# Altium schematic sheet MPS27102017.schdoc
size A3
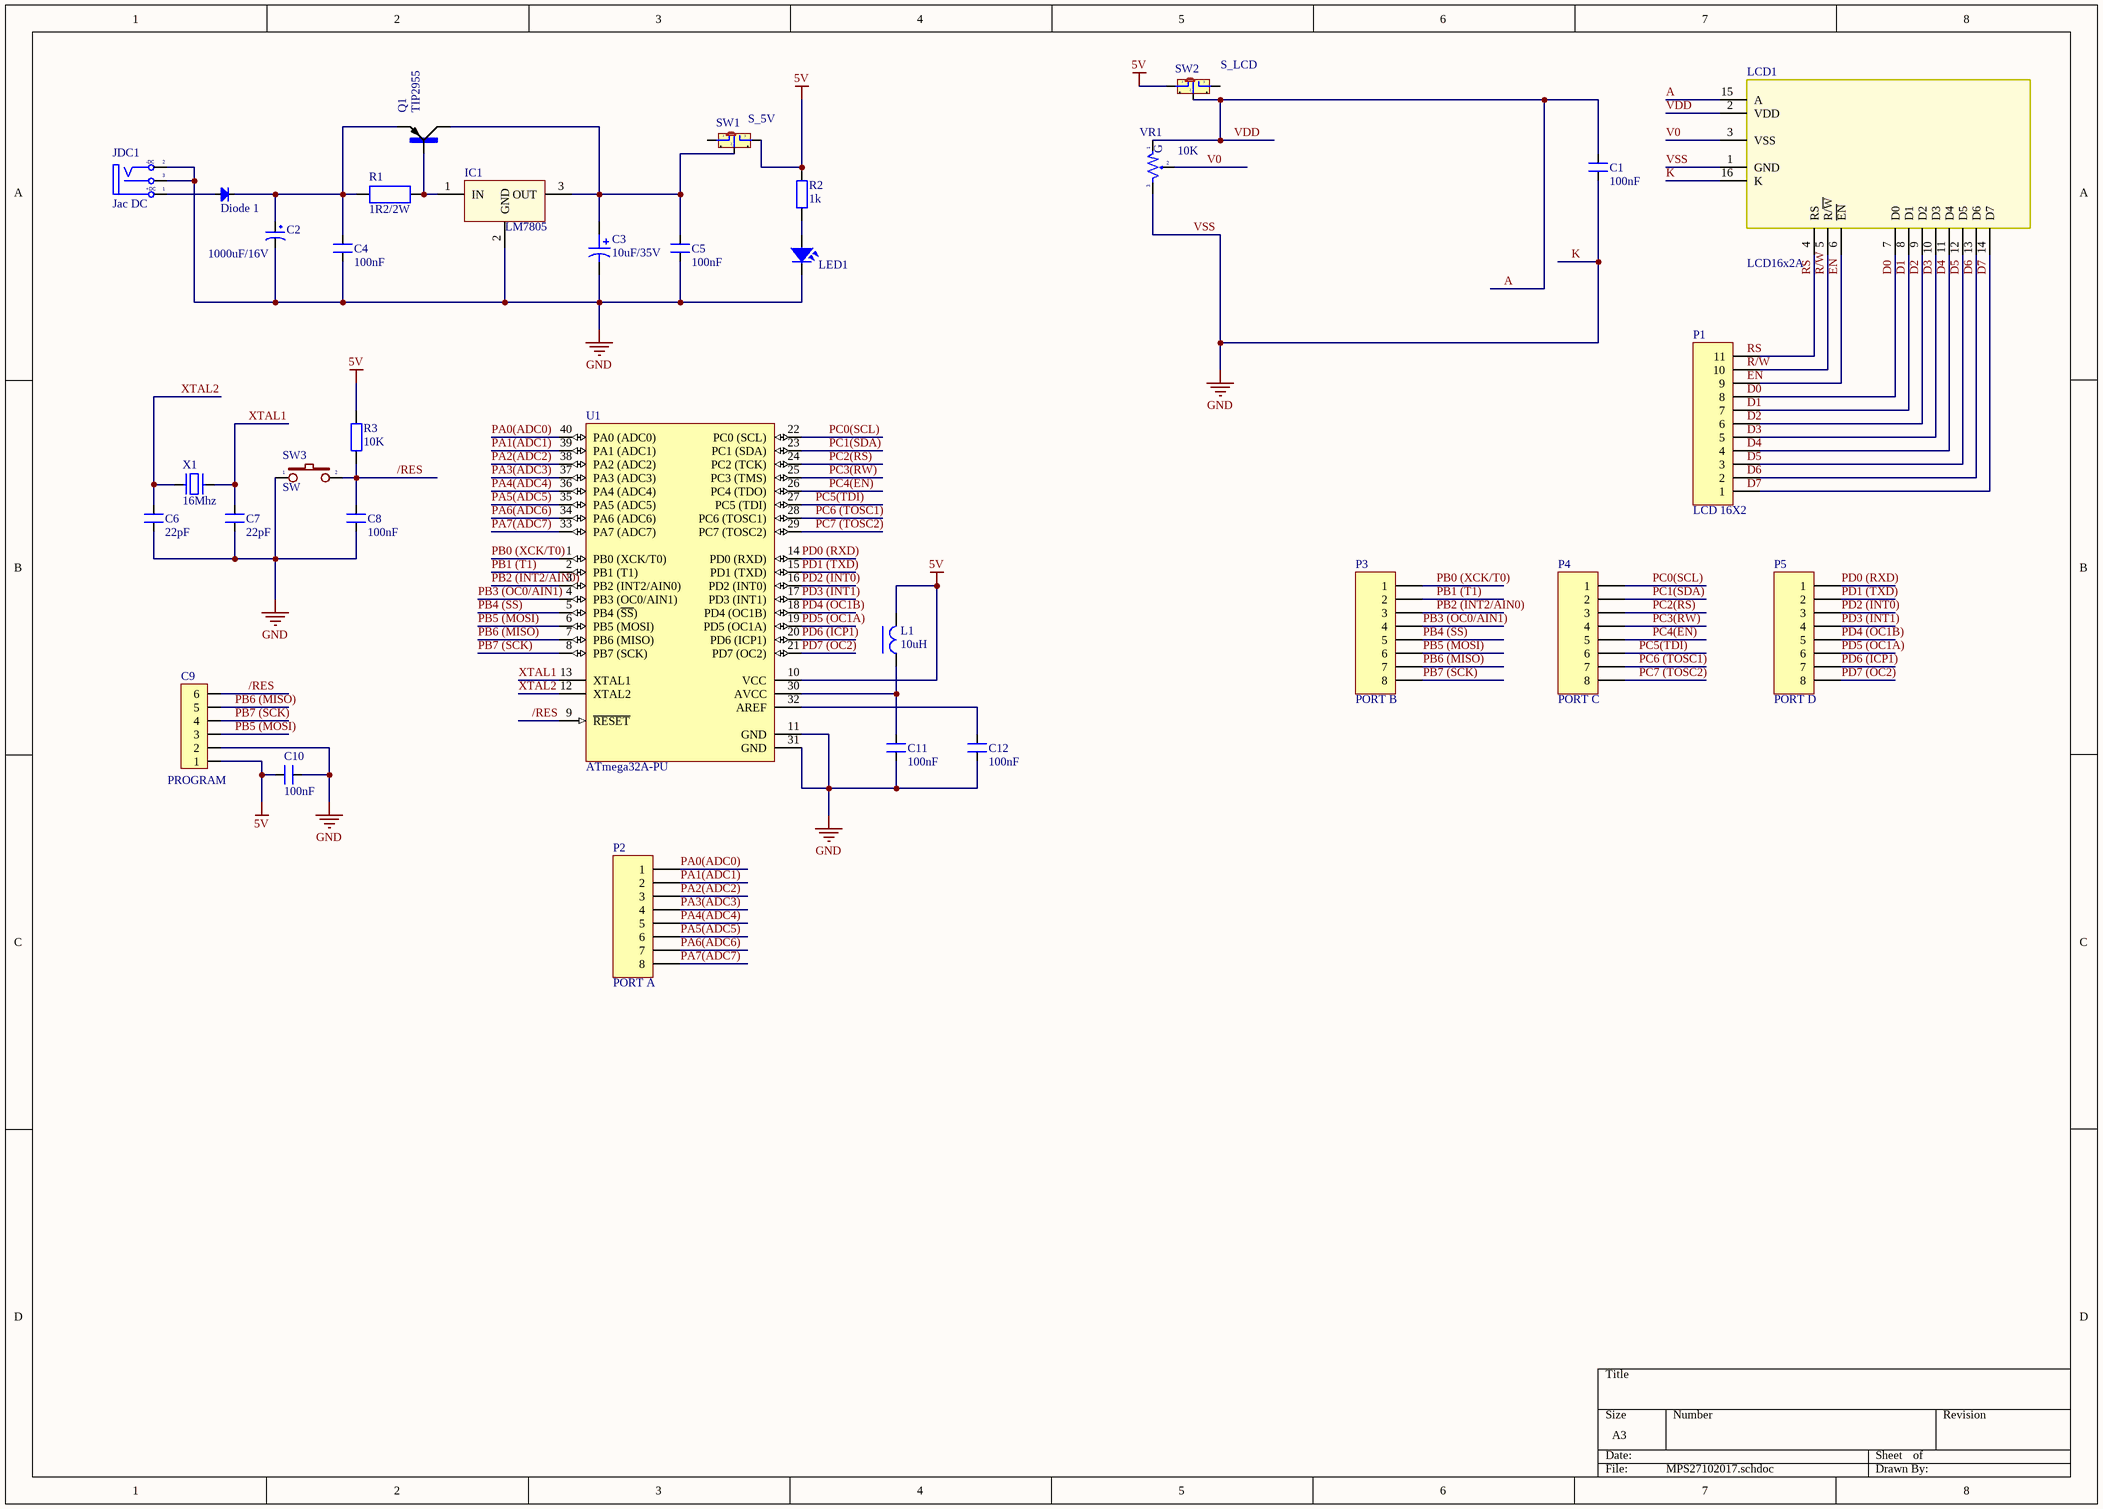
[diagram p0: MPS27102017.schdoc]

## Parts
C1  100nF  [CN1]
C2  1000uF/16V  [CP1.5/3.4]
C3  value 10uF/35V  [RADIAL B]  (hidden comment: Cap Pol)
C4  100nF  [CN1]
C5  100nF  [CN1]
C6  22pF  [CN1]
C7  22pF  [CN1]
C8  100nF  [CN1]
C9  PROGRAM  [Header6]
C10  100nF  [CN1]
C11  100nF  [CN1]
C12  100nF  [CN1]
Diode_1  Diode 1N5404  [DIO-5A - LONG]  (value not drawn)
IC1  LM7805  [QTO-220H3]
JDC1  Jac DC  [DC0]
L1  10uH  [RES-1/2W]
LCD1  LCD16x2A  [LCD16X2]
LED1  LED  [LED-3MM-YELLOW]  (value not drawn)
P1  LCD 16X2  [HDR1X11]
P2  PORT A  [Header 8]
P3  PORT B  [Header 8]
P4  PORT C  [Header 8]
P5  PORT D  [Header 8]
Q1  TIP2955  [TOP3AV_TIP2955(Primary)]
R1  1R2/2W  [R2W]
R2  1k  [R1/4W]
R3  10K  [R1/4W]
SW1  S_5V  [SW102]
SW2  S_LCD  [SW102]
SW3  SW  [SW2]
U1  ATmega32A-PU  [DIP40/W0.6]
VR1  10K  [VR-S2]
X1  16Mhz  [XT2]

## Nets
5V: C9.1 C10.1 L1.2 R2.2 R3.2 SW1.3 SW2.1 U1.10(VCC)
K: C1.1 C2.2 C3.2 C4.1 C5.1 C6.1 C7.1 C8.1 C9.2 C10.2 C11.1 C12.1 IC1.2(GND) JDC1.2(TN) JDC1.3(S) LCD1.1(GND) LCD1.16(K) LED1.2 SW3.1 U1.11(GND) U1.31(GND) VR1.3  [also labelled GND, VSS]
/RES: C8.2 C9.6 R3.1 SW3.2 U1.9(~{RESET})
A: C1.2 LCD1.2(VDD) LCD1.15(A) SW2.2 VR1.1  [also labelled VDD]
D0: LCD1.7(D0) P1.8
D1: LCD1.8(D1) P1.7
D2: LCD1.9(D2) P1.6
D3: LCD1.10(D3) P1.5
D4: LCD1.11(D4) P1.4
D5: LCD1.12(D5) P1.3
D6: LCD1.13(D6) P1.2
D7: LCD1.14(D7) P1.1
EN: LCD1.6(~{EN}) P1.9
PA0(ADC0): P2.1 U1.40(PA0_(ADC0))
PA1(ADC1): P2.2 U1.39(PA1_(ADC1))
PA2(ADC2): P2.3 U1.38(PA2_(ADC2))
PA3(ADC3): P2.4 U1.37(PA3_(ADC3))
PA4(ADC4): P2.5 U1.36(PA4_(ADC4))
PA5(ADC5): P2.6 U1.35(PA5_(ADC5))
PA6(ADC6): P2.7 U1.34(PA6_(ADC6))
PA7(ADC7): P2.8 U1.33(PA7_(ADC7))
PB0 (XCK/T0): P3.1 U1.1(PB0_(XCK/T0))
PB1 (T1): P3.2 U1.2(PB1_(T1))
PB2 (INT2/AIN0): P3.3 U1.3(PB2_(INT2/AIN0))
PB3 (OC0/AIN1): P3.4 U1.4(PB3_(OC0/AIN1))
PB4 (SS): P3.5 U1.5(PB4_(~{SS}))
PB5 (MOSI): C9.3 P3.6 U1.6(PB5_(MOSI))
PB6 (MISO): C9.5 P3.7 U1.7(PB6_(MISO))
PB7 (SCK): C9.4 P3.8 U1.8(PB7_(SCK))
PC0(SCL): P4.1 U1.22(PC0_(SCL))
PC1(SDA): P4.2 U1.23(PC1_(SDA))
PC2(RS): P4.3 U1.24(PC2_(TCK))
PC3(RW): P4.4 U1.25(PC3_(TMS))
PC4(EN): P4.5 U1.26(PC4_(TDO))
PC5(TDI): P4.6 U1.27(PC5_(TDI))
PC6 (TOSC1): P4.7 U1.28(PC6_(TOSC1))
PC7 (TOSC2): P4.8 U1.29(PC7_(TOSC2))
PD0 (RXD): P5.1 U1.14(PD0_(RXD))
PD1 (TXD): P5.2 U1.15(PD1_(TXD))
PD2 (INT0): P5.3 U1.16(PD2_(INT0))
PD3 (INT1): P5.4 U1.17(PD3_(INT1))
PD4 (OC1B): P5.5 U1.18(PD4_(OC1B))
PD5 (OC1A): P5.6 U1.19(PD5_(OC1A))
PD6 (ICP1): P5.7 U1.20(PD6_(ICP1))
PD7 (OC2): P5.8 U1.21(PD7_(OC2))
R/W: LCD1.5(R/~{W}) P1.10
RS: LCD1.4(RS) P1.11
V0: LCD1.3(VSS) VR1.2
XTAL1: C7.2 U1.13(XTAL1) X1.1
XTAL2: C6.2 U1.12(XTAL2) X1.2
NetC2_1: C2.1 C4.2 Diode_1.2(K) Q1.E R1.1
NetC3_1: C3.1 C5.2 IC1.3(OUT) Q1.C SW1.2
NetC11_2: C11.2 L1.1 U1.30(AVCC)
NetC12_2: C12.2 U1.32(AREF)
NetDiode_1_1: Diode_1.1(A) JDC1.1(T)
NetIC1_1: IC1.1(IN) Q1.B R1.2
NetLED1_1: LED1.1 R2.1

Not connected (* = marked no-connect by the designer): SW1 1 4 5; SW2 3 4 5

## Notes on the sheet
- Labels drawn without touching a wire or pin: D0, D1, D2, D3, D4, D5, D6, D7, EN, R/W, RS
- (in symbol DCIN) -DC; +DC
- (in symbol VR-S) G

## Library data of the parts
C1 C4-C8 C10-C12 = CN1: Cap np  1pF - 472pF; Value: 100pF
C2 = CP4: Cap 1000uF/16V - 220uF/50V; Description 5: 4,7uF>10uF/250V_3,3uF>10uF/400V - 2,2uF>4,7uF/450V; Description 1: 2200uF-3300uF/6,3V - 1000uF-2200uF/10V; Description 2: 1000uF/16V - 470uF => 1000uF/25V - 100uF/100V; Description 3: 330uF>470uF/35V_220uF>470uF/50V_10uF>22uF/250V; Description 4: 220uF => 330uF/63V - 10uF =>33uF/160 - 200V; Value: 1000uF/16V
C3 = Cap Pol: Polarized Capacitor; Published: 8-Jun-2000; LatestRevisionDate: 17-Jul-2002; LatestRevisionNote: Re-released for DXP Platform.; PackageReference: POLAR0.8; Publisher: Altium Limited
C9 = Header6: Header IDC, 6 x 1 Pin Vertical 2.54mm Pitch (Non-Boxed, Male); Manufacturer: W¨¹rth Elektronik eiSos GmbH; partNo: 613002143121; ComponentLink1 Description: Manufacturer; ComponentLink2 Description: Datasheet; NoPins: 02; Created Date: 29 March 2013; ComponentLink1URL: http://www.we-online.com; ComponentLink2URL: http://katalog.we-online.de/em/datasheet/6130xx143121.pdf; Created by: Karrer Zheng
Diode_1 = Diode: Default Diode; Code - JEDEC: DO-214-AB; Value: 1N5007; Published: 8-Jun-2000; Revision: July-2002: Re-released for DXP Platform.; Publisher: Altium Limited
IC1 = LM78xx_1: On ap +, from + 5 to + 24VDC; Value: LM7805
JDC1 = DCIN: Jac DC input; Value: Jac DC
L1 = L-DIP-1: Inductor; Value: 150 mH
LCD1 = LCD16x2: LCD dipslay 16 char, 2 line; Value: LCD16x2A
LED1 = LED: LED Single colour Green and Red; Value: LED 3 ly Single Colour
P1 = Header 11: Header, 11-Pin; LatestRevisionDate: 17-Jul-2002; LatestRevisionNote: Re-released for DXP Platform.; Publisher: Altium Limited
P2-P5 = Header 8: Header, 8-Pin; LatestRevisionDate: 17-Jul-2002; LatestRevisionNote: Re-released for DXP Platform.; Publisher: Altium Limited
Q1 = TIP2955: TIP2955 Series PNP 60 V 15 A Complementary Power Darlington Transistor -TO-247-3; MF: STMicroelectronics; Availability: Good; Package: TO-247-3 STMicroelectronics; MP: TIP2955; Price: 1.31 USD; Value: *
R1 = R2W: Resistor 2W; Value: R2W - 47
R2 R3 = R1/4W: Resistor 1/4W; Value: R1/4W - 1K
SW1 SW2 = SW102A: Switch 102 on Broad; Value: Switch 102 On Board
SW3 = SW2: Switch button 2 pin; Value: SW chip 2 pin
U1 = ATmega32A-PU: 8-Bit AVR Microcontroller with 32K Bytes of In-System Programmable Flash Memory; Published: 17-Sep-2003; DatasheetVersion: 2503C-AVR-10/02; PackageVersion: revB, Sep-2001; PackageReference: 40P6; Publisher: Altium Limited; PackageDescription: 40-lead (0.600"/15.24mm Wide) Plastic Dual Inline Package (PDIP); Supplier 1: Digi-Key; Supplier Part Number 1: ATMEGA32-16PC-ND; Supplier 2: Mouser; Supplier Part Number 2: 556-ATMEGA32-16PC; Code_JEDEC: MS-011-AC; ComponentLink1Description: Datasheet; ComponentLink1URL: http://www.atmel.com/dyn/resources/prod_documents/doc2503.pdf; ComponentLink2Description: Atmel.com Home; ComponentLink2URL: http://www.atmel.com
VR1 = VR-S: Var Resistor; Value: Volume 50k
X1 = XT2: Crystal, 32.768 KHz, -40 to 85 degC, 3.2 x 1.5 x 0.9 mm SMD; Value: 4Mhz